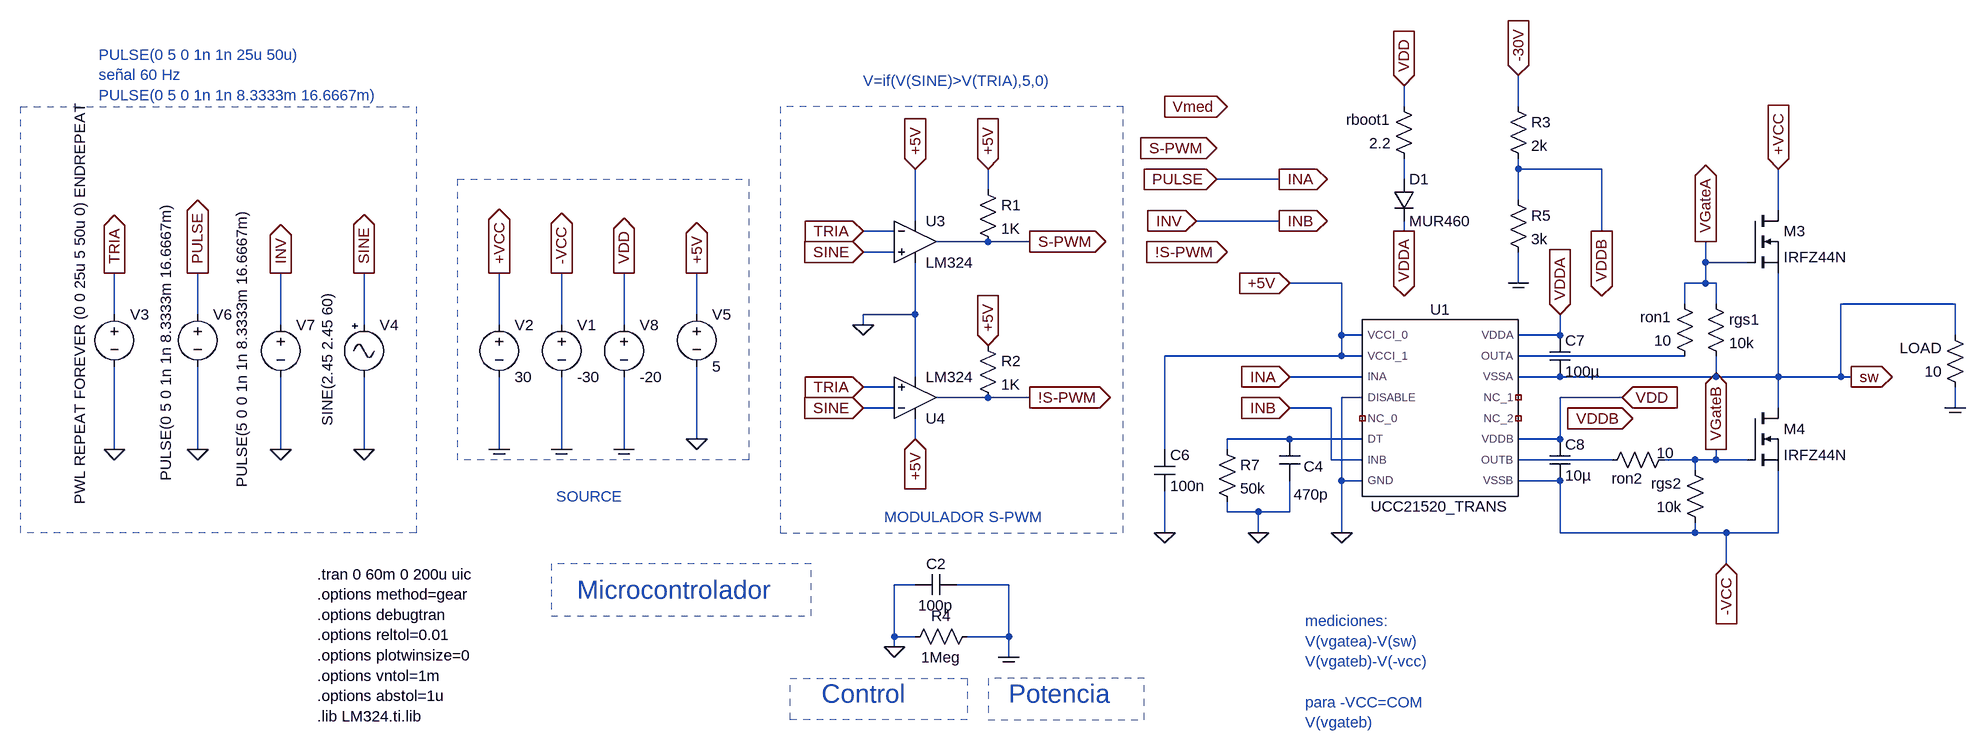
[diagram p0: schematic inversor.asc]
inversor.asc, the LTspice schematic file:
Version 4.1
SHEET 1 3588 2388
WIRE 944 -240 944 -272
WIRE 1120 -240 1120 -288
WIRE 1120 -144 1120 -160
WIRE 1248 -144 1120 -144
WIRE 752 -128 656 -128
WIRE 944 -128 944 -160
WIRE 304 -112 304 -144
WIRE 1120 -96 1120 -144
WIRE 1520 -80 1520 -144
WIRE 192 -64 192 -144
WIRE 752 -64 624 -64
WIRE 160 -48 112 -48
WIRE 944 -48 944 -64
WIRE 1248 -48 1248 -144
WIRE 304 -32 224 -32
WIRE 368 -32 304 -32
WIRE 160 -16 112 -16
WIRE 1408 0 1408 -32
WIRE 1472 0 1408 0
WIRE 848 32 768 32
WIRE 1120 32 1120 -16
WIRE 1408 32 1408 0
WIRE 1408 32 1376 32
WIRE 1424 32 1408 32
WIRE 1376 64 1376 32
WIRE 1424 64 1424 32
WIRE 1792 64 1616 64
WIRE -1040 80 -1040 16
WIRE -912 80 -912 16
WIRE -144 80 -144 16
WIRE 192 80 192 0
WIRE 192 80 112 80
WIRE -784 96 -784 16
WIRE -656 96 -656 16
WIRE -448 96 -448 16
WIRE -352 96 -352 16
WIRE -256 96 -256 16
WIRE 112 96 112 80
WIRE 848 112 848 32
WIRE 880 112 848 112
WIRE 1184 112 1184 80
WIRE 1184 112 1120 112
WIRE 1792 112 1792 64
WIRE 848 144 848 112
WIRE 848 144 576 144
WIRE 880 144 848 144
WIRE 1376 144 1120 144
WIRE 192 176 192 80
WIRE 880 176 768 176
WIRE 1184 176 1120 176
WIRE 1424 176 1424 144
WIRE 1424 176 1184 176
WIRE 1520 176 1520 16
WIRE 1520 176 1424 176
WIRE 1616 176 1616 64
WIRE 1616 176 1520 176
WIRE 1632 176 1616 176
WIRE 160 192 112 192
WIRE 304 208 224 208
WIRE 368 208 304 208
WIRE 880 208 848 208
WIRE 1280 208 1184 208
WIRE 160 224 112 224
WIRE 832 224 768 224
WIRE 1520 224 1520 176
WIRE 1792 224 1792 192
WIRE -144 272 -144 160
WIRE 192 272 192 240
WIRE 768 272 672 272
WIRE 880 272 768 272
WIRE 1184 272 1184 208
WIRE 1184 272 1120 272
WIRE -1040 288 -1040 160
WIRE -912 288 -912 160
WIRE -784 288 -784 176
WIRE -656 288 -656 176
WIRE -448 288 -448 176
WIRE -352 288 -352 176
WIRE -256 288 -256 176
WIRE 576 288 576 144
WIRE 672 288 672 272
WIRE 832 304 832 224
WIRE 880 304 832 304
WIRE 1264 304 1120 304
WIRE 1392 304 1344 304
WIRE 1424 304 1424 288
WIRE 1424 304 1392 304
WIRE 1472 304 1424 304
WIRE 1392 320 1392 304
WIRE 848 336 848 208
WIRE 880 336 848 336
WIRE 1184 336 1120 336
WIRE 672 384 672 368
WIRE 720 384 672 384
WIRE 768 384 768 336
WIRE 768 384 720 384
WIRE 576 416 576 352
WIRE 720 416 720 384
WIRE 848 416 848 336
WIRE 1184 416 1184 336
WIRE 1392 416 1392 400
WIRE 1392 416 1184 416
WIRE 1440 416 1392 416
WIRE 1520 416 1520 320
WIRE 1520 416 1440 416
WIRE 1440 464 1440 416
WIRE 192 496 160 496
WIRE 336 496 256 496
WIRE 160 576 160 496
WIRE 192 576 160 576
WIRE 336 576 336 496
WIRE 336 576 272 576
WIRE 160 592 160 576
WIRE 336 608 336 576
FLAG -352 16 -VCC
IOPIN -352 16 Out
FLAG 160 592 0
FLAG 336 608 COM
FLAG 192 -144 +5V
IOPIN 192 -144 In
FLAG 368 -32 S-PWM
IOPIN 368 -32 Out
FLAG 112 -16 SINE
IOPIN 112 -16 In
FLAG 112 192 TRIA
IOPIN 112 192 In
FLAG 192 272 +5V
IOPIN 192 272 In
FLAG 112 96 0
FLAG 368 208 !S-PWM
IOPIN 368 208 Out
FLAG 112 224 SINE
IOPIN 112 224 In
FLAG 112 -48 TRIA
IOPIN 112 -48 In
FLAG 304 128 +5V
IOPIN 304 128 In
FLAG 304 -144 +5V
IOPIN 304 -144 In
FLAG -448 288 COM
FLAG -448 16 +VCC
IOPIN -448 16 Out
FLAG -656 288 0
FLAG -656 16 SINE
IOPIN -656 16 Out
FLAG -1040 16 TRIA
IOPIN -1040 16 Out
FLAG -144 272 0
FLAG -144 16 +5V
IOPIN -144 16 Out
FLAG 656 -176 S-PWM
IOPIN 656 -176 In
FLAG 672 -16 !S-PWM
IOPIN 672 -16 In
FLAG -1040 288 0
FLAG -912 288 0
FLAG -912 16 PULSE
IOPIN -912 16 Out
FLAG 768 32 +5V
IOPIN 768 32 In
FLAG 848 416 0
FLAG 752 -128 INA
IOPIN 752 -128 Out
FLAG 656 -128 PULSE
IOPIN 656 -128 In
FLAG 1520 -144 +VCC
IOPIN 1520 -144 In
FLAG 720 416 0
FLAG 576 416 0
FLAG -784 288 0
FLAG -784 16 INV
IOPIN -784 16 Out
FLAG 624 -64 INV
IOPIN 624 -64 In
FLAG 576 -240 Vmed
IOPIN 576 -240 Out
FLAG 1184 80 VDDA
IOPIN 1184 80 In
FLAG 944 -48 VDDA
IOPIN 944 -48 Out
FLAG 1248 -48 VDDB
IOPIN 1248 -48 Out
FLAG 752 -64 INB
IOPIN 752 -64 Out
FLAG 768 176 INA
IOPIN 768 176 In
FLAG 768 224 INB
IOPIN 768 224 In
FLAG 1632 176 sw
IOPIN 1632 176 Out
FLAG 1424 288 VGateB
IOPIN 1424 288 Out
FLAG 1408 -32 VGateA
IOPIN 1408 -32 Out
FLAG 1792 224 COM
FLAG 1440 464 -VCC
IOPIN 1440 464 In
FLAG -256 288 COM
FLAG -256 16 VDD
IOPIN -256 16 Out
FLAG -352 288 COM
FLAG 1296 240 VDDB
IOPIN 1296 240 In
FLAG 1120 -288 -30V
IOPIN 1120 -288 In
FLAG 1280 208 VDD
IOPIN 1280 208 In
FLAG 944 -272 VDD
IOPIN 944 -272 In
FLAG 1120 32 COM
SYMBOL voltage -352 80 R0
SYMATTR InstName V1
SYMATTR Value -30
SYMBOL cap 256 480 R90
WINDOW 0 0 32 VBottom 2
WINDOW 3 32 32 VTop 2
SYMATTR InstName C2
SYMATTR Value 100p
SYMBOL res 288 560 R90
WINDOW 0 0 56 VBottom 2
WINDOW 3 32 56 VTop 2
SYMATTR InstName R4
SYMATTR Value 1Meg
SYMBOL sym\\OpAmps\\opamp2 192 -96 R0
SYMATTR InstName U3
SYMATTR Value LM324
SYMBOL sym\\OpAmps\\opamp2 192 272 M180
SYMATTR InstName U4
SYMATTR Value LM324
SYMBOL res 288 -128 R0
SYMATTR InstName R1
SYMATTR Value 1K
SYMBOL res 288 112 R0
SYMATTR InstName R2
SYMATTR Value 1K
SYMBOL voltage -448 80 R0
WINDOW 123 0 0 Left 0
WINDOW 39 0 0 Left 0
SYMATTR InstName V2
SYMATTR Value 30
SYMBOL sym\\Misc\\signal -656 80 R0
WINDOW 3 -56 -35 VRight 2
SYMATTR Value SINE(2.45 2.45 60)
SYMATTR InstName V4
SYMBOL voltage -144 64 R0
SYMATTR InstName V5
SYMATTR Value 5
SYMBOL voltage -1040 64 R0
WINDOW 3 -53 309 VLeft 2
WINDOW 123 0 0 Left 0
WINDOW 39 0 0 Left 0
SYMATTR Value PWL REPEAT FOREVER (0 0 25u 5 50u 0) ENDREPEAT
SYMATTR InstName V3
SYMBOL voltage -912 64 R0
WINDOW 3 -49 273 VLeft 2
WINDOW 123 0 0 Left 0
WINDOW 39 0 0 Left 0
SYMATTR Value PULSE(0 5 0 1n 1n 8.3333m 16.6667m)
SYMATTR InstName V6
SYMBOL UCC21520_TRANS 992 224 R0
SYMATTR InstName U1
SYMBOL nmos 1472 -80 R0
SYMATTR InstName M3
SYMATTR Value IRFZ44N
SYMBOL cap 752 272 R0
WINDOW 0 38 42 Left 2
WINDOW 3 22 85 Left 2
SYMATTR InstName C4
SYMATTR Value 470p
SYMBOL res 656 272 R0
SYMATTR InstName R7
SYMATTR Value 50k
SYMBOL cap 560 288 R0
SYMATTR InstName C6
SYMATTR Value 100n
SYMBOL res 960 -144 R180
WINDOW 0 36 76 Left 2
WINDOW 3 36 40 Left 2
SYMATTR InstName rboot1
SYMATTR Value 2.2
SYMBOL diode 928 -128 R0
SYMATTR InstName D1
SYMATTR Value MUR460
SYMBOL cap 1168 112 R0
SYMATTR InstName C7
SYMATTR Value 100µ
SYMBOL res 1392 160 R180
WINDOW 0 36 76 Left 2
WINDOW 3 36 40 Left 2
SYMATTR InstName ron1
SYMATTR Value 10
SYMBOL res 1408 48 R0
SYMATTR InstName rgs1
SYMATTR Value 10k
SYMBOL nmos 1472 224 R0
SYMATTR InstName M4
SYMATTR Value IRFZ44N
SYMBOL cap 1168 272 R0
SYMATTR InstName C8
SYMATTR Value 10µ
SYMBOL res 1360 288 R90
WINDOW 0 60 72 VBottom 2
WINDOW 3 -10 14 VTop 2
SYMATTR InstName ron2
SYMATTR Value 10
SYMBOL res 1408 416 R180
WINDOW 0 36 76 Left 2
WINDOW 3 36 40 Left 2
SYMATTR InstName rgs2
SYMATTR Value 10k
SYMBOL voltage -784 80 R0
WINDOW 3 -60 -165 VRight 2
WINDOW 123 0 0 Left 0
WINDOW 39 0 0 Left 0
SYMATTR Value PULSE(5 0 0 1n 1n 8.3333m 16.6667m)
SYMATTR InstName V7
SYMBOL res 1808 208 R180
WINDOW 0 36 76 Left 2
WINDOW 3 36 40 Left 2
SYMATTR InstName LOAD
SYMATTR Value 10
SYMBOL voltage -256 80 R0
WINDOW 123 0 0 Left 0
WINDOW 39 0 0 Left 0
SYMATTR InstName V8
SYMATTR Value -20
SYMBOL res 1104 -256 R0
SYMATTR InstName R3
SYMATTR Value 2k
SYMBOL res 1104 -112 R0
SYMATTR InstName R5
SYMATTR Value 3k
TEXT 144 392 Left 2 ;MODULADOR S-PWM
TEXT -328 504 Left 4 ;Microcontrolador
TEXT 336 664 Left 4 ;Potencia
TEXT 48 664 Left 4 ;Control
TEXT -728 480 Left 2 !.tran 0 60m 0 200u uic\n.options method=gear\n.options debugtran\n.options reltol=0.01\n.options plotwinsize=0\n.options vntol=1m\n.options abstol=1u\n.lib LM324.ti.lib
TEXT -360 360 Left 2 ;SOURCE
TEXT 112 -280 Left 2 ;V=if(V(SINE)>V(TRIA),5,0)
TEXT -1064 -320 Left 2 ;PULSE(0 5 0 1n 1n 25u 50u)\nseñal 60 Hz\nPULSE(0 5 0 1n 1n 8.3333m 16.6667m)
TEXT 792 552 Left 2 ;mediciones:\nV(vgatea)-V(sw)\nV(vgateb)-V(-vcc)\n \npara -VCC=COM\nV(vgateb)
RECTANGLE Normal 32 464 -368 544 2
RECTANGLE Normal 0 640 272 704 2
RECTANGLE Normal 544 640 304 704 2
RECTANGLE Normal 512 -240 -16 416 2
RECTANGLE Normal -64 304 -512 -128 2
RECTANGLE Normal -576 416 -1184 -240 2

The netlist it stands for:
* inversor.asc
V1 -VCC COM -30
C2 COM 0 100p
R4 COM 0 1Meg
X§U3 SINE TRIA +5V 0 S-PWM LM324  ; pins In+ In- V+ V- OUT
X§U4 TRIA SINE +5V 0 !S-PWM LM324  ; pins In+ In- V+ V- OUT
R1 +5V S-PWM 1K
R2 +5V !S-PWM 1K
V2 +VCC COM 30
V4 SINE 0 SINE(2.45 2.45 60)
V5 +5V 0 5
V3 TRIA 0 PWL REPEAT FOREVER (0 0 25u 5 50u 0) ENDREPEAT
V6 INA 0 PULSE(0 5 0 1n 1n 8.3333m 16.6667m)
X§U1 0 N003 0 INA INB N002 N004 +5V +5V VDDA VDD sw -VCC NC_01 NC_02 NC_03 UCC21520_TRANS  ; pins DISABLE DT GND INA INB OUTA OUTB VCCI_0 VCCI_1 VDDA VDDB VSSA VSSB NC_0 NC_1 NC_2
M3 +VCC VGateA sw sw IRFZ44N
C4 N003 0 470p
R7 N003 0 50k
C6 +5V 0 100n
rboot1 N001 VDD 2.2
D1 N001 VDDA MUR460
C7 VDDA sw 100µ
ron1 N002 VGateA 10
rgs1 VGateA sw 10k
M4 sw VGateB -VCC -VCC IRFZ44N
C8 VDD -VCC 10µ
ron2 VGateB N004 10
rgs2 -VCC VGateB 10k
V7 INB 0 PULSE(5 0 0 1n 1n 8.3333m 16.6667m)
R§LOAD COM sw 10
V8 VDD COM -20
R3 -30V VDDB 2k
R5 VDDB COM 3k
.model D D
.lib standard.dio
.model NMOS NMOS
.model PMOS PMOS
.lib standard.mos
* MODULADOR S-PWM
* Microcontrolador
* Potencia
* Control
.tran 0 60m 0 200u uic
.options method=gear
.options debugtran
.options reltol=0.01
.options plotwinsize=0
.options vntol=1m
.options abstol=1u
.lib LM324.ti.lib
* SOURCE
* V=if(V(SINE)>V(TRIA),5,0)
* PULSE(0 5 0 1n 1n 25u 50u)
* señal 60 Hz
* PULSE(0 5 0 1n 1n 8.3333m 16.6667m)
* mediciones:
* V(vgatea)-V(sw)
* V(vgateb)-V(-vcc)
* para -VCC=COM
* V(vgateb)
.lib UCC21520_TRANS.lib
.backanno
.end